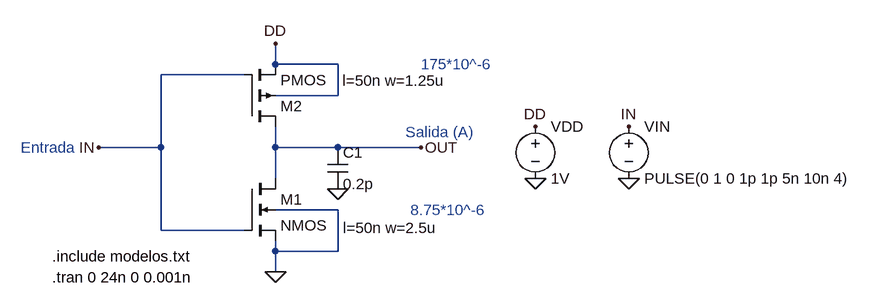
[diagram p0: schematic 1d.asc]
1d.asc, the LTspice schematic file:
Version 4
SHEET 1 1048 680
WIRE 112 32 112 0
WIRE 208 32 112 32
WIRE 64 48 -64 48
WIRE 208 80 208 32
WIRE 208 80 112 80
WIRE -64 160 -64 48
WIRE -64 160 -160 160
WIRE 112 160 112 128
WIRE 208 160 112 160
WIRE 336 160 208 160
WIRE 112 208 112 160
WIRE 208 256 112 256
WIRE -64 288 -64 160
WIRE 64 288 -64 288
WIRE 112 320 112 304
WIRE 208 320 208 256
WIRE 208 320 112 320
WIRE 112 352 112 320
FLAG 512 208 0
FLAG 656 208 0
FLAG 112 352 0
FLAG 112 0 DD
FLAG 512 128 DD
FLAG 656 128 IN
FLAG -160 160 IN
FLAG 336 160 OUT
FLAG 208 224 0
SYMBOL nmos4 64 208 R0
WINDOW 123 152 76 Left 2
SYMATTR Value2 l=50n w=2.5u
SYMATTR InstName M1
SYMBOL pmos4 64 128 M180
WINDOW 123 151 71 Left 2
SYMATTR Value2 l=50n w=1.25u
SYMATTR InstName M2
SYMBOL voltage 512 112 R0
SYMATTR InstName VDD
SYMATTR Value 1V
SYMBOL voltage 656 112 R0
WINDOW 123 0 0 Left 0
WINDOW 39 0 0 Left 0
SYMATTR InstName VIN
SYMATTR Value PULSE(0 1 0 1p 1p 5n 10n 4)
SYMBOL cap 192 160 R0
SYMATTR InstName C1
SYMATTR Value 0.2p
TEXT -232 328 Left 2 !.include modelos.txt
TEXT -232 360 Left 2 !.tran 0 24n 0 0.001n
TEXT 312 136 Left 2 ;Salida (A)
TEXT -280 160 Left 2 ;Entrada
TEXT 320 256 Left 2 ;8.75*10^-6
TEXT 336 32 Left 2 ;175*10^-6

The netlist it stands for:
* 1d.asc
M1 OUT IN 0 0 NMOS l=50n w=2.5u
M2 OUT IN DD DD PMOS l=50n w=1.25u
VDD DD 0 1V
VIN IN 0 PULSE(0 1 0 1p 1p 5n 10n 4)
C1 OUT 0 0.2p
.model NMOS NMOS
.model PMOS PMOS
.lib standard.mos
.include modelos.txt
.tran 0 24n 0 0.001n
* Salida (A)
* Entrada
* 8.75*10^-6
* 175*10^-6
.backanno
.end